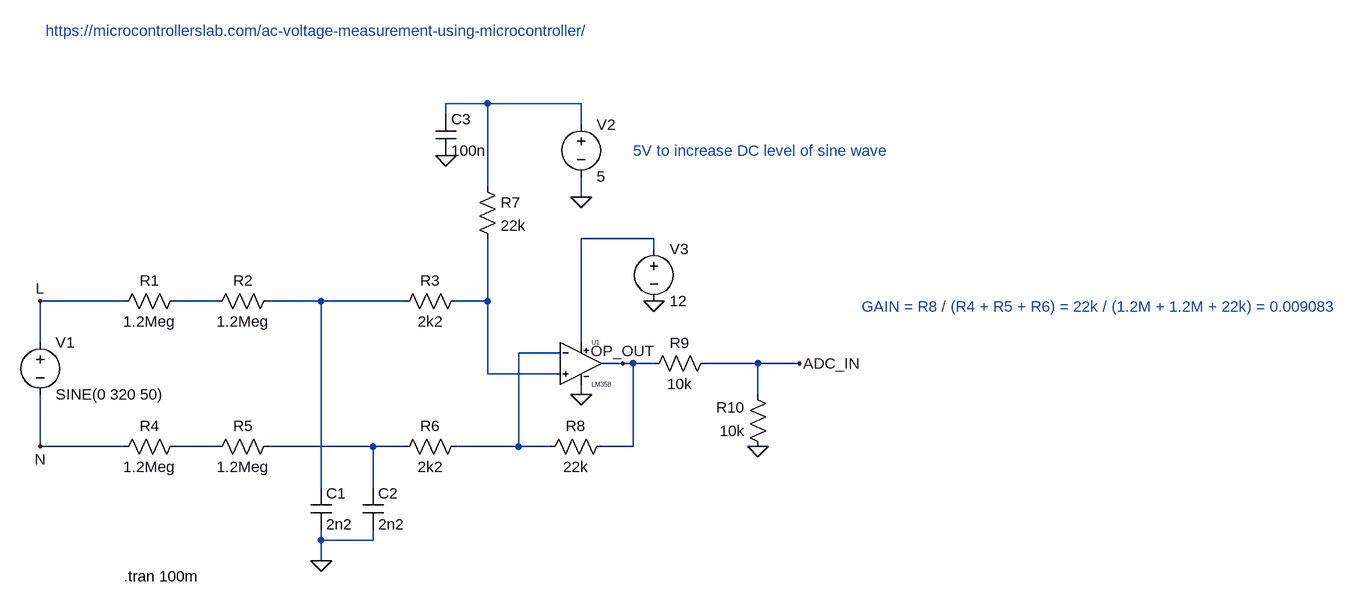
[diagram p0: schematic mains_measure.asc]
mains_measure.asc, the LTspice schematic file:
Version 4.1
SHEET 1 1940 680
WIRE 544 -208 480 -208
WIRE 688 -208 544 -208
WIRE 480 -192 480 -208
WIRE 688 -176 688 -208
WIRE 544 -80 544 -208
WIRE 688 -64 688 -96
WIRE 800 0 688 0
WIRE 800 16 800 0
WIRE -16 96 -144 96
WIRE 128 96 64 96
WIRE 288 96 208 96
WIRE 416 96 288 96
WIRE 544 96 544 0
WIRE 544 96 496 96
WIRE -144 160 -144 96
WIRE 688 160 688 0
WIRE 656 176 592 176
WIRE 752 192 720 192
WIRE 768 192 752 192
WIRE 800 192 768 192
WIRE 960 192 880 192
WIRE 1024 192 960 192
WIRE 544 208 544 96
WIRE 656 208 544 208
WIRE 688 240 688 224
WIRE 960 240 960 192
WIRE -144 320 -144 240
WIRE -16 320 -144 320
WIRE 128 320 64 320
WIRE 368 320 208 320
WIRE 416 320 368 320
WIRE 592 320 592 176
WIRE 592 320 496 320
WIRE 640 320 592 320
WIRE 768 320 768 192
WIRE 768 320 720 320
WIRE 288 384 288 96
WIRE 368 384 368 320
WIRE 288 464 288 448
WIRE 368 464 368 448
WIRE 368 464 288 464
WIRE 288 496 288 464
FLAG 288 496 0
FLAG 688 240 0
FLAG 688 -64 0
FLAG 480 -128 0
FLAG 800 96 0
FLAG 960 320 0
FLAG 1024 192 ADC_IN
FLAG 752 192 OP_OUT
FLAG -144 96 L
FLAG -144 320 N
SYMBOL voltage -144 144 R0
WINDOW 123 0 0 Left 0
WINDOW 39 0 0 Left 0
SYMATTR InstName V1
SYMATTR Value SINE(0 320 50)
SYMBOL res 80 80 R90
WINDOW 0 0 56 VBottom 2
WINDOW 3 32 56 VTop 2
SYMATTR InstName R1
SYMATTR Value 1.2Meg
SYMBOL res 512 80 R90
WINDOW 0 0 56 VBottom 2
WINDOW 3 32 56 VTop 2
SYMATTR InstName R3
SYMATTR Value 2k2
SYMBOL res 80 304 R90
WINDOW 0 0 56 VBottom 2
WINDOW 3 32 56 VTop 2
SYMATTR InstName R4
SYMATTR Value 1.2Meg
SYMBOL res 512 304 R90
WINDOW 0 0 56 VBottom 2
WINDOW 3 32 56 VTop 2
SYMATTR InstName R6
SYMATTR Value 2k2
SYMBOL cap 272 384 R0
SYMATTR InstName C1
SYMATTR Value 2n2
SYMBOL cap 352 384 R0
SYMATTR InstName C2
SYMATTR Value 2n2
SYMBOL LM358 688 128 R0
SYMATTR InstName U1
SYMBOL res 528 -96 R0
SYMATTR InstName R7
SYMATTR Value 22k
SYMBOL voltage 688 -192 R0
WINDOW 123 0 0 Left 0
WINDOW 39 0 0 Left 0
SYMATTR InstName V2
SYMATTR Value 5
SYMBOL cap 464 -192 R0
SYMATTR InstName C3
SYMATTR Value 100n
SYMBOL voltage 800 0 R0
WINDOW 123 0 0 Left 0
WINDOW 39 0 0 Left 0
SYMATTR InstName V3
SYMATTR Value 12
SYMBOL res 736 304 R90
WINDOW 0 0 56 VBottom 2
WINDOW 3 32 56 VTop 2
SYMATTR InstName R8
SYMATTR Value 22k
SYMBOL res 896 176 R90
WINDOW 0 0 56 VBottom 2
WINDOW 3 32 56 VTop 2
SYMATTR InstName R9
SYMATTR Value 10k
SYMBOL res 976 336 R180
WINDOW 0 36 76 Left 2
WINDOW 3 36 40 Left 2
SYMATTR InstName R10
SYMATTR Value 10k
SYMBOL res 224 80 R90
WINDOW 0 0 56 VBottom 2
WINDOW 3 32 56 VTop 2
SYMATTR InstName R2
SYMATTR Value 1.2Meg
SYMBOL res 224 304 R90
WINDOW 0 0 56 VBottom 2
WINDOW 3 32 56 VTop 2
SYMATTR InstName R5
SYMATTR Value 1.2Meg
TEXT -16 520 Left 2 !.tran 100m
TEXT -136 -320 Left 2 ;https://microcontrollerslab.com/ac-voltage-measurement-using-microcontroller/
TEXT 768 -136 Left 2 ;5V to increase DC level of sine wave
TEXT 1120 104 Left 2 ;GAIN = R8 / (R4 + R5 + R6) = 22k / (1.2M + 1.2M + 22k) = 0.009083

The netlist it stands for:
* mains_measure.asc
V1 L N SINE(0 320 50)
R1 N003 L 1.2Meg
R3 N005 N004 2k2
R4 N007 N 1.2Meg
R6 N006 N008 2k2
C1 N004 0 2n2
C2 N008 0 2n2
X§U1 N005 N006 N002 0 OP_OUT LMX58_LM2904  ; pins IN+ IN- VCC VEE OUT
R7 N001 N005 22k
V2 N001 0 5
C3 N001 0 100n
V3 N002 0 12
R8 OP_OUT N006 22k
R9 ADC_IN OP_OUT 10k
R10 0 ADC_IN 10k
R2 N004 N003 1.2Meg
R5 N008 N007 1.2Meg
.tran 100m
* https://microcontrollerslab.com/ac-voltage-measurement-using-microcontroller/
* 5V to increase DC level of sine wave
* GAIN = R8 / (R4 + R5 + R6) = 22k / (1.2M + 1.2M + 22k) = 0.009083
.lib LMx58_LM2904.lib
.backanno
.end